# Altium schematic sheet Piezo_Regulator_Head_Power.SchDoc (part 2 of 3)
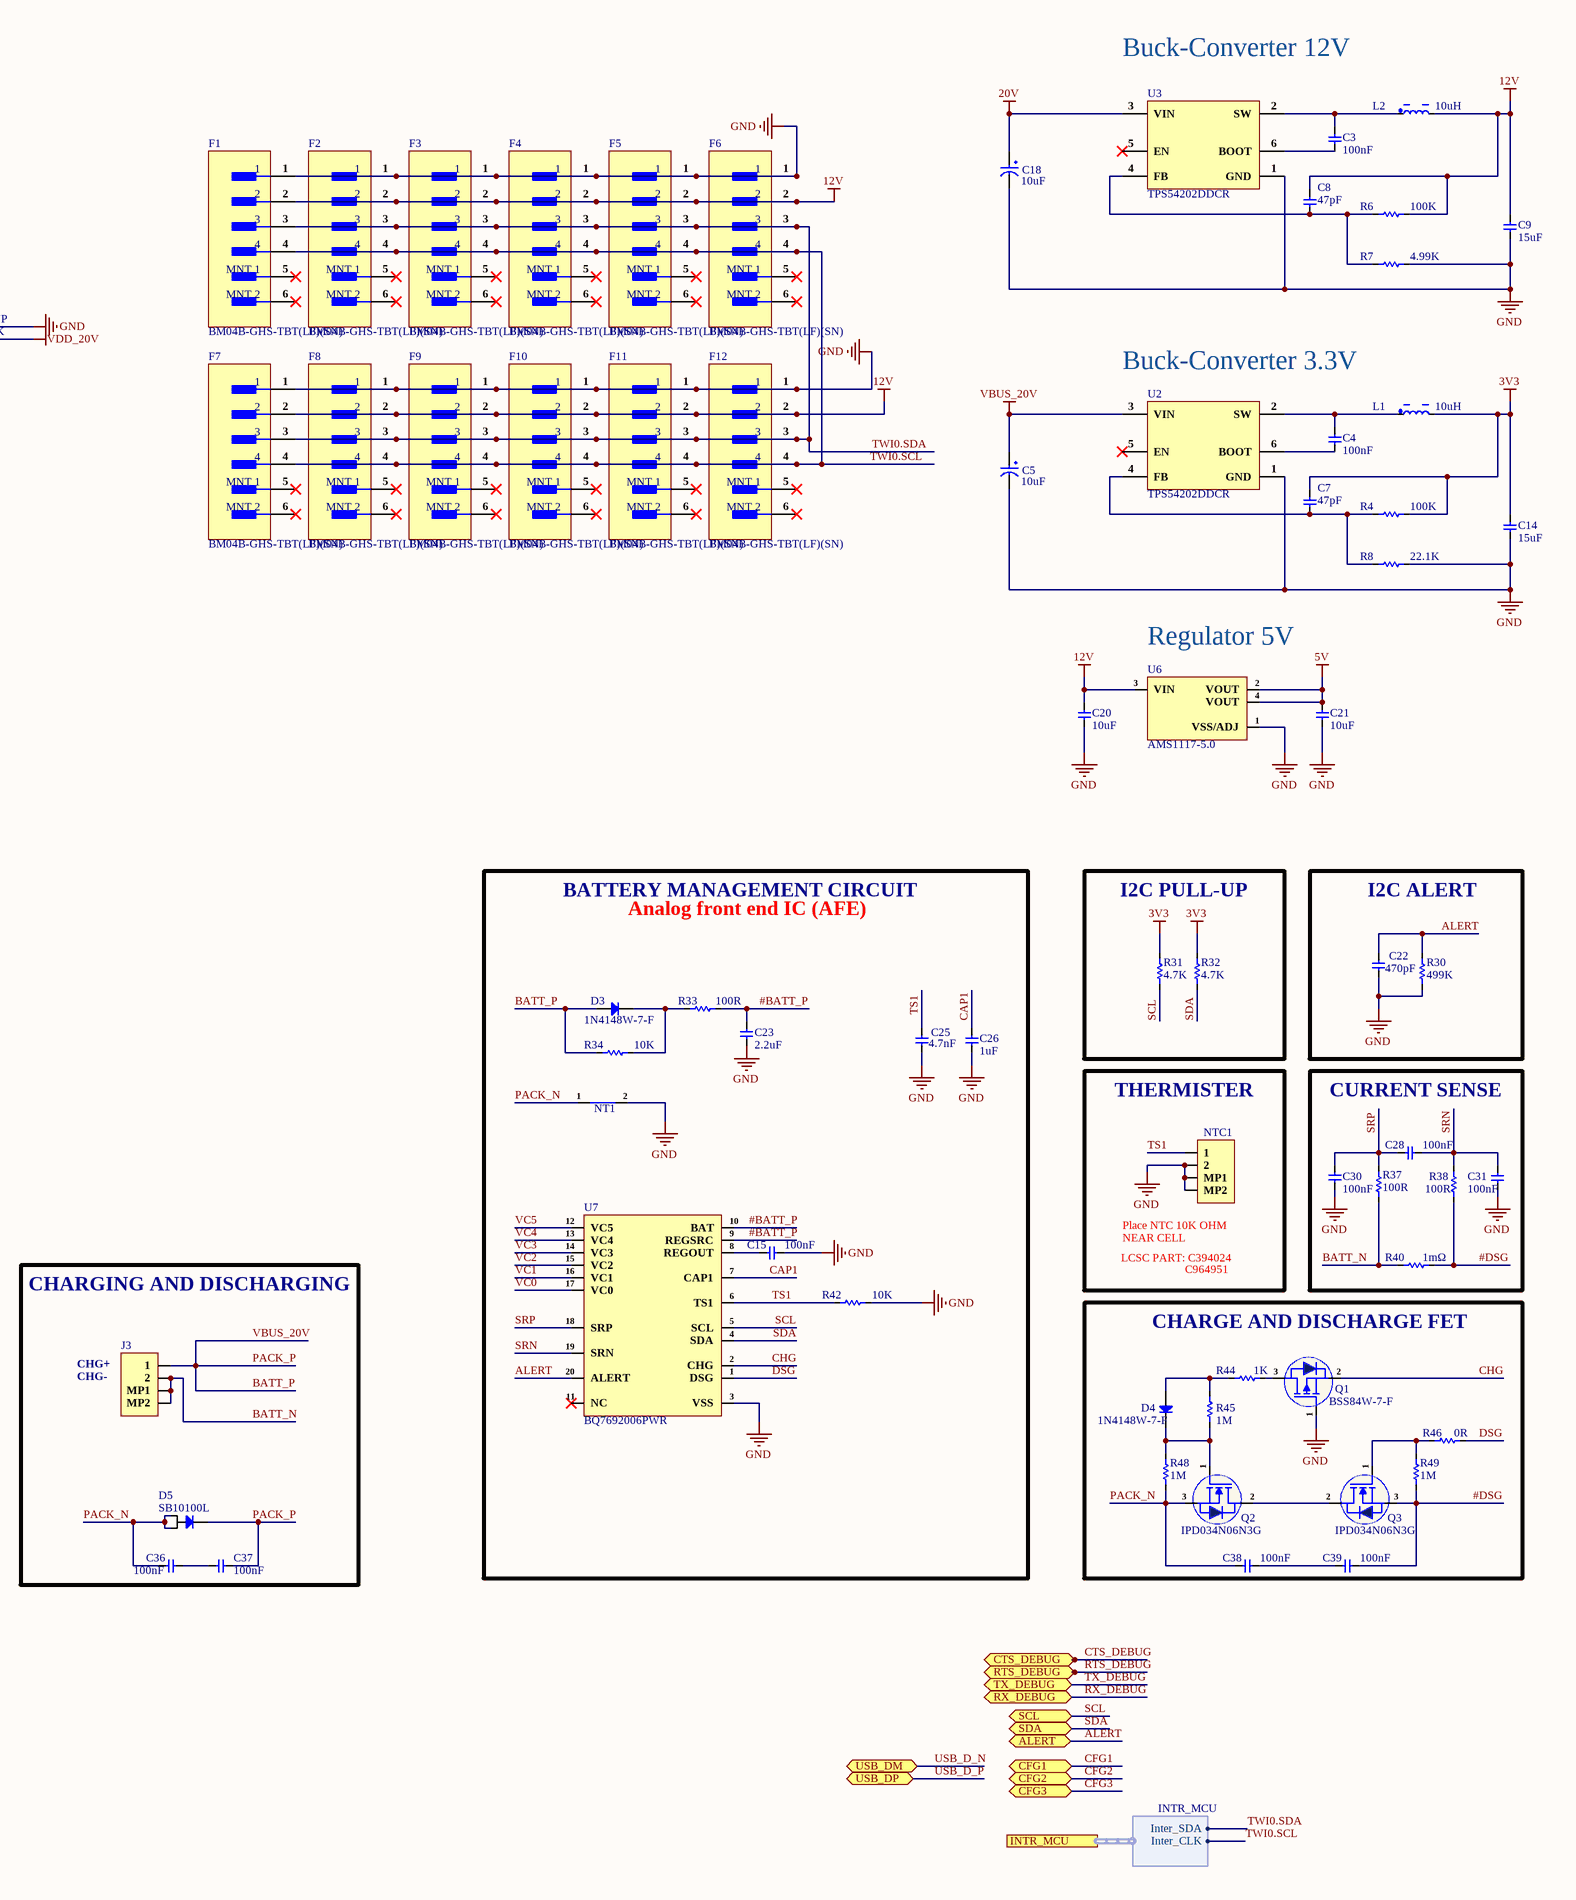
[diagram p2: Piezo_Regulator_Head_Power.SchDoc, right]
## Library data of the parts
C3 C4 C15 C28 C30 C31 C36-C39 = CC0603KRX5R9BB104: CAP CER 0.1UF 50V X5R 0603; Manufacturer: Yageo; Tolerance: 10%; Item Type: Capacitor; Supplier 1: Digi-Key; Manufacturer Part Number: CC0603KRX5R9BB104; RoHS: Yes; Category: Ceramic Capacitors; Stock 1: 152253; Pricing 1: 1=0.10000, 10=0.05200, 50=0.02820, 100=0.02310, 500=0.01648, 1000=0.01294 (USD); Mount: Surface Mount; Case/Package: 0603; Case Code (Imperial): 0603; Case Code (Metric): 1608; Weight: 7.1E-05oz; Min Operating Temperature: -55°C; Max Operating Temperature: 85°C; Capacitance: 100nF; Packaging: Tape and Reel; Voltage Rating: 50V; Dielectric: X5R; Termination: SMD/SMT; Voltage Rating (DC): 50V; Package Quantity: 4000; Length: 0.063inch; Width: 0.031inch; Thickness: 0.035inch; Lead Free: Lead Free; Halogen Free: Halogen Free; ComponentLink1URL: http://www.mouser.com/ds/2/447/Yageo_UPY-GP_NP0_16V-to-50V_9-358835.pdf?src-supplier=Mouser; ComponentLink1Description: http://www.mouser.com/ds/2/447/Yageo_UPY-GP_NP0_16V-to-50V_9-358835.pdf?src-supplier=Mouser; ComponentLink2URL: https://www.yageo.com/upload/media/product/productsearch/datasheet/mlcc/UPY-GPHC_X5R_4V-to-50V_26.pdf?src-supplier=Digi-Key; ComponentLink2Description: https://www.yageo.com/upload/media/product/productsearch/datasheet/mlcc/UPY-GPHC_X5R_4V-to-50V_26.pdf?src-supplier=Digi-Key; ComponentLink3URL: http://www.yageo.com/exep/pages/download/literatures/ProductSelectionGuide%202014_Final_2.pdf?src-supplier=Digi-Key; ComponentLink3Description: http://www.yageo.com/exep/pages/download/literatures/ProductSelectionGuide%202014_Final_2.pdf?src-supplier=Digi-Key; Supplier Part Number 1: 311-4046-1-ND; LCSC Part Number: C110022
C5 C18 = TAJC106K035RNJ: CAP TANT 10UF 10% 35V 2312; Manufacturer: Kyocera AVX; Item Type: Tantalum Capacitors; Dielectric Material: Tantalum; Tolerance: 20%; ESR (Equivalent Series Resistance): 1.6R; Leakage Current: 3.5uA; Polarity: Polar; Voltage: 25V; Dissipation Factor: 6%; Life (Hours): 2000Hour; Ripple Current: 262mA; Supplier: Avnet; Supplier Part Number: TAJC106K035RNJ; Manufacturer Part Number: TAJC106K035RNJ; RoHS: Yes; Stock: 20000; Pricing: 500=0.4611, 1000=0.4505, 2000=0.4399, 3000=0.4293, 4000=0.4187, 5000=0.4081, 50000=0.4028 (USD); Mounting Technology: Surface Mount,PCB; Case/Package: Molded; Pins: 2; Case Code (Imperial): 2312; Case Code (Metric): 6032; Min Operating Temperature: -55°C; Max Operating Temperature: 125°C; Value: 10uF; Voltage Rating (DC): 35V; Voltage Rating: 35V; Features: General Purpose; Series: TAJ; Packaging: Tape and Reel; Package Quantity: 500; Termination: SMD/SMT; Construction: Flat; Length: 6mm; Width: 3.2mm; Height: 2.6mm; Depth: 3.2mm; Radiation Hardening: No; Lead Free: Lead Free; RoHS Compliant: Yes; Reach SVHC Compliant: No; ComponentLink1URL: https://datasheet.ciiva.com/11793/0900766b80ccdc61-11793205.pdf?src-supplier=Rs; ComponentLink1Description: https://datasheet.ciiva.com/11793/0900766b80ccdc61-11793205.pdf?src-supplier=Rs; ComponentLink2URL: https://datasheet.ciiva.com/26341/559442-da-01-en-tacc-c-6-0-mm-x-3-2-mm-x-2-6-mm-10-uf-26341782.pdf?src-supplier=Conrad; ComponentLink2Description: https://datasheet.ciiva.com/26341/559442-da-01-en-tacc-c-6-0-mm-x-3-2-mm-x-2-6-mm-10-uf-26341782.pdf?src-supplier=Conrad; ComponentLink3URL: https://datasheet.ciiva.com/5937/taj-5937099.pdf?src-supplier=Farnell; ComponentLink3Description: https://datasheet.ciiva.com/5937/taj-5937099.pdf?src-supplier=Farnell; ComponentLink4URL: https://datasheet.ciiva.com/7730/taj-7730983.pdf?src-supplier=Element14; ComponentLink4Description: https://datasheet.ciiva.com/7730/taj-7730983.pdf?src-supplier=Element14; ComponentLink5URL: https://datasheet.ciiva.com/7730/1703059-7730751.pdf?src-supplier=Element14; ComponentLink5Description: https://datasheet.ciiva.com/7730/1703059-7730751.pdf?src-supplier=Element14; ComponentLink6URL: https://datasheet.ciiva.com/7730/1703059-7730750.pdf?src-supplier=Element14; ComponentLink6Description: https://datasheet.ciiva.com/7730/1703059-7730750.pdf?src-supplier=Element14; ComponentLink7URL: https://datasheet.ciiva.com/7730/1680476-7730748.pdf?src-supplier=Element14; ComponentLink7Description: https://datasheet.ciiva.com/7730/1680476-7730748.pdf?src-supplier=Element14; ComponentLink8URL: https://datasheet.ciiva.com/7730/13070-7730749.pdf?src-supplier=Element14; ComponentLink8Description: https://datasheet.ciiva.com/7730/13070-7730749.pdf?src-supplier=Element14; ComponentLink9URL: https://datasheet.ciiva.com/264/taj-264350.pdf?src-supplier=Digikey; ComponentLink9Description: https://datasheet.ciiva.com/264/taj-264350.pdf?src-supplier=Digikey; ComponentLink10URL: https://datasheet.ciiva.com/264/taj-264349.pdf?src-supplier=Digikey; ComponentLink10Description: https://datasheet.ciiva.com/264/taj-264349.pdf?src-supplier=Digikey; ComponentLink11URL: https://datasheet.ciiva.com/264/taj-264351.pdf?src-supplier=Digikey; ComponentLink11Description: https://datasheet.ciiva.com/264/taj-264351.pdf?src-supplier=Digikey; ComponentLink12URL: https://datasheet.ciiva.com/12911/taj-27497-12911561.pdf?src-supplier=Mouser; ComponentLink12Description: https://datasheet.ciiva.com/12911/taj-27497-12911561.pdf?src-supplier=Mouser; ComponentLink13URL: https://datasheet.ciiva.com/14590/70001050-14590313.pdf?src-supplier=Allied+Electronics; ComponentLink13Description: https://datasheet.ciiva.com/14590/70001050-14590313.pdf?src-supplier=Allied+Electronics; ComponentLink14URL: https://datasheet.ciiva.com/3004/taj-3004476.pdf?src-supplier=Avnet; ComponentLink14Description: https://datasheet.ciiva.com/3004/taj-3004476.pdf?src-supplier=Avnet; ComponentLink15URL: https://datasheet.ciiva.com/15163/getdatasheetpartid-110753-15163367.pdf?src-supplier=Verical; ComponentLink15Description: https://datasheet.ciiva.com/15163/getdatasheetpartid-110753-15163367.pdf?src-supplier=Verical; ComponentLink16URL: https://datasheet.ciiva.com/3004/taj-3004475.pdf?src-supplier=Avnet; ComponentLink16Description: https://datasheet.ciiva.com/3004/taj-3004475.pdf?src-supplier=Avnet; LCSC Part Number: C7211
C7 C8 = CC0603FRNPO9BN470: CAP CER 47PF 50V NPO 0603; Manufacturer: Yageo; Item Type: Capacitor; Supplier: Digikey; LCSC Part Number: C519486; Manufacturer Part Number: CC0603FRNPO9BN470; RoHS: Yes; Stock: 37282; Pricing: 1=0.19, 10=0.126, 50=0.0756, 100=0.0594, 500=0.0439, 1000=0.03634 (USD); ComponentLink1URL: https://datasheet.ciiva.com/5425/upy-gp-np0-16v-to-50v-8-5425545.pdf?src-supplier=Mouser; ComponentLink1Description: https://datasheet.ciiva.com/5425/upy-gp-np0-16v-to-50v-8-5425545.pdf?src-supplier=Mouser; ComponentLink2URL: https://datasheet.ciiva.com/11586/upy-gp-np0-16v-to-50v-8-11586472.pdf?src-supplier=Avnet; ComponentLink2Description: https://datasheet.ciiva.com/11586/upy-gp-np0-16v-to-50v-8-11586472.pdf?src-supplier=Avnet
C9 C14 = C3216X5R1V156M160AC: CAP CER 15UF 35V X5R 1206; Manufacturer: TDK; Manufacturer Lifecycle Status: PRODUCTION; Item Type: Capacitors; Value: 15µF; Dielectric Material: Ceramic; Tolerance: 20%; Supplier: Avnet; Supplier Part Number: 71AH3361; Manufacturer Part Number: C3216X5R1V156M160AC; RoHS: Compliant; Stock: 2242; Pricing: 1=0.987, 10=0.517, 25=0.485, 50=0.453, 100=0.421 (USD); Case/Package: 1206; Case Code (Imperial): 1206; Case Code (Metric): 3216; China RoHS: Compliant; Composition: Ceramic; Dielectric: X5R; Height: 1.6mm; Lead Free: Lead Free; Length: 3.2mm; Lifecycle Status: Production; Material: Ceramic; Max Length: 3.4mm; Max Operating Temperature: 85°C; Max Width: 1.8mm; Min Length: 3mm; Min Operating Temperature: -55°C; Min Width: 1.4mm; Mounting Technology: Surface Mount; Number of Terminals: 2; Packaging: Digi-Reel®; REACH SVHC: Yes; Schedule B: 8532240020, 8532240020|8532240020|8532240020|8532240020|8532240020; Termination: SMD/SMT; Voltage Rating: 35V; Voltage Rating (DC): 35V; Width: 1.6mm; ComponentLink1URL: https://datasheet.octopart.com:443/C3216X5R1V156M160AC-TDK-datasheet-175423548.pdf?src-supplier=TME; ComponentLink1Description: https://datasheet.octopart.com:443/C3216X5R1V156M160AC-TDK-datasheet-175423548.pdf?src-supplier=TME; ComponentLink2URL: https://datasheet.octopart.com:443/C3216X5R1V156M160AC-TDK-datasheet-151546523.pdf?src-supplier=TDK; ComponentLink2Description: https://datasheet.octopart.com:443/C3216X5R1V156M160AC-TDK-datasheet-151546523.pdf?src-supplier=TDK; ComponentLink3URL: https://datasheet.octopart.com/C3216X5R1V156M160AC-TDK-datasheet-41194876.pdf; ComponentLink3Description: https://datasheet.octopart.com/C3216X5R1V156M160AC-TDK-datasheet-41194876.pdf
C19 = 08055C105KAT2A: CAP CER 1UF 50V X7R 0805; Manufacturer: Kyocera AVX; Item Type: Capacitors; Material: Ceramic; Tolerance: 10%; Supplier: Rs; LCSC Part Number: C2167382; Manufacturer Part Number: 08055C105KAT2A; RoHS: Yes; Stock: 6530; Pricing: 10=1.518, 50=1.406, 100=1.309, 250=1.137, 500=0.98 (DKK); Mounting Technology: Surface Mount; Case/Package: 0805; Case Code (Metric): 2012; Case Code (Imperial): 0805; Min Operating Temperature: -55°C; Max Operating Temperature: 125°C; Value: 1uF; Dielectric: X7R; Termination: SMD/SMT; Voltage: 50V; Packaging: Tape and Reel; Voltage Rating: 50V; Package Quantity: 1; Series: -; Length: 2.01mm; Width: 0.049inch; Depth: 1.25mm; Thickness: 0.037inch; Reach SVHC Compliant: No; Lead Free: Lead Free; RoHS Compliant: Yes; ComponentLink1URL: https://datasheet.ciiva.com/25613/0900766b810a29b7-25613127.pdf?src-supplier=Rs; ComponentLink1Description: https://datasheet.ciiva.com/25613/0900766b810a29b7-25613127.pdf?src-supplier=Rs; ComponentLink2URL: https://datasheet.ciiva.com/6268/cx7r-6268826.pdf?src-supplier=Digikey; ComponentLink2Description: https://datasheet.ciiva.com/6268/cx7r-6268826.pdf?src-supplier=Digikey; ComponentLink3URL: https://datasheet.ciiva.com/7812/cx7r-7812085.pdf?src-supplier=Element14; ComponentLink3Description: https://datasheet.ciiva.com/7812/cx7r-7812085.pdf?src-supplier=Element14; ComponentLink4URL: https://datasheet.ciiva.com/22706/1679506-22706999.pdf?src-supplier=Element14; ComponentLink4Description: https://datasheet.ciiva.com/22706/1679506-22706999.pdf?src-supplier=Element14; ComponentLink5URL: https://datasheet.ciiva.com/46385/1818074-46385893.pdf?src-supplier=Element14; ComponentLink5Description: https://datasheet.ciiva.com/46385/1818074-46385893.pdf?src-supplier=Element14; ComponentLink6URL: https://datasheet.ciiva.com/14887/cx7r-14887080.pdf?src-supplier=Digikey; ComponentLink6Description: https://datasheet.ciiva.com/14887/cx7r-14887080.pdf?src-supplier=Digikey; ComponentLink7URL: https://datasheet.ciiva.com/14887/cx7r-14887081.pdf?src-supplier=Digikey; ComponentLink7Description: https://datasheet.ciiva.com/14887/cx7r-14887081.pdf?src-supplier=Digikey
C20 C21 = C1608X5R1E106M080AC: CAP CER 10UF 25V X5R 0603; Manufacturer: TDK; Dielectric Material: Ceramic; Tolerance: 20%; Item Type: Capacitor; Supplier 1: Digi-Key; Manufacturer Part Number: C1608X5R1E106M080AC; Stock 1: 61681; Pricing 1: 1=0.96, 10=0.704, 100=0.483, 500=0.38238, 1000=0.322 (USD); Mount: Surface Mount; Case/Package: 0603; Weight: 7.1E-05oz; Case Code (Imperial): 0603; Case Code (Metric): 1608; Min Operating Temperature: -55°C; Max Operating Temperature: 85°C; Capacitance: 10uF; Packaging: Tape and Reel; Voltage Rating: 25V; Voltage Rating (DC): 25V; Termination: SMD/SMT; Package Quantity: 1; Dielectric: X5R; Composition: Ceramic; Length: 1.6mm; Height: 0.8mm; Width: 0.8mm; Thickness: 0.039inch; Depth: 0.8mm; Lead Free: Lead Free; REACH SVHC: No SVHC; Supplier Part Number 1: 445-9015-1-ND; LCSC Part Number: C2168289
C22 = 0603B471K500CT: CAP CER 470PF 50V X7R 0603; Manufacturer: Walsin Technologies; Tolerance: 10%; Item Type: Capacitor; Supplier 1: Arrow Electronics; Manufacturer Part Number: 0603B471K500CT; RoHS: Yes; Category: Ceramic Capacitors; Stock 1: 136000; Pricing 1: 4000=0.00550, 8000=0.00460, 12000=0.00440, 40000=0.00430 (USD); Case/Package: Ceramic; Case Code (Metric): 1608; Case Code (Imperial): 0603; Min Operating Temperature: -55°C; Max Operating Temperature: 125°C; Capacitance: 470pF; Packaging: Tape and Reel; Dielectric: X7R; Voltage Rating: 50V; Voltage Rating (DC): 50V; Length: 1.6mm; Depth: 0.8mm; Radiation Hardening: No; RoHS Compliant: Yes; REACH SVHC: Unknown; Lead Free: Lead Free; ComponentLink1URL: https://www.verical.com/server-webapp/html/getDatasheet?partID=467798&src-supplier=Verical; ComponentLink1Description: https://www.verical.com/server-webapp/html/getDatasheet?partID=467798&src-supplier=Verical; ComponentLink2URL: http://www.farnell.com/datasheets/2340522.pdf?src-supplier=Farnell; ComponentLink2Description: http://www.farnell.com/datasheets/2340522.pdf?src-supplier=Farnell; ComponentLink3URL: http://www.passivecomponent.com/indexsea/0603B471K500CT-IS.pdf?src-supplier=Digi-Key; ComponentLink3Description: http://www.passivecomponent.com/indexsea/0603B471K500CT-IS.pdf?src-supplier=Digi-Key; ComponentLink4URL: http://www.passivecomponent.com/wp-content/uploads/2018/10/MLCC.pdf?src-supplier=Digi-Key; ComponentLink4Description: http://www.passivecomponent.com/wp-content/uploads/2018/10/MLCC.pdf?src-supplier=Digi-Key; ComponentLink5URL: http://www.farnell.com/datasheets/1958513.pdf?src-supplier=Element14; ComponentLink5Description: http://www.farnell.com/datasheets/1958513.pdf?src-supplier=Element14; ComponentLink6URL: http://www.farnell.com/datasheets/2340522.pdf?src-supplier=Newark; ComponentLink6Description: http://www.farnell.com/datasheets/2340522.pdf?src-supplier=Newark; Supplier Part Number 1: 0603B471K500CT; LCSC Part Number: C93192
C23 = CC0805KKX5R9BB225: CAP CER 2.2UF 50V X5R 0805; Manufacturer: Yageo; Tolerance: 10%; Item Type: Capacitor; Supplier 1: Mouser; Manufacturer Part Number: CC0805KKX5R9BB225; RoHS: Yes; Category: Ceramic Capacitors; Stock 1: 3880; Pricing 1: 1=0.26000, 10=0.12100, 50=0.12100, 100=0.08700, 1000=0.06700, 10000=0.05000 (USD); Mounting Technology: Surface Mount; Case/Package: 0805; Case Code (Metric): 2012; Case Code (Imperial): 0805; Weight: 0.000194oz; Min Operating Temperature: -55°C; Max Operating Temperature: 85°C; Packaging: Tape and Reel; Value: 2.2uF; Voltage Rating: 50V; Dielectric: X5R; Termination: SMD/SMT; Resistor Type: Ceramic; Voltage Rating (DC): 50V; Package Quantity: 3000; Length: 0.079inch; Width: 1.25mm; Thickness: 0.057inch; Lead Free: Lead Free; Halogen Free: Halogen Free; RoHS Compliant: Yes; ComponentLink1URL: http://www.mouser.com/ds/2/447/Yageo_UPY-GP_NP0_16V-to-50V_9-358835.pdf?src-supplier=Mouser; ComponentLink1Description: http://www.mouser.com/ds/2/447/Yageo_UPY-GP_NP0_16V-to-50V_9-358835.pdf?src-supplier=Mouser; ComponentLink2URL: http://www.yageo.com/documents/recent/UPY-GPHC_X5R_4V-to-50V_25.pdf?src-supplier=Digi-Key; ComponentLink2Description: http://www.yageo.com/documents/recent/UPY-GPHC_X5R_4V-to-50V_25.pdf?src-supplier=Digi-Key; Supplier Part Number 1: 603-CC805KKX5R9BB225; LCSC Part Number: C326581
C25 = CC0603JRNPO9BN472: CAP CER 4700PF 50V C0G/NPO 0603; Manufacturer: Yageo; Item Type: Capacitor; Supplier 1: Digi-Key; Manufacturer Part Number: CC0603JRNPO9BN472; RoHS: Yes; Category: Ceramic Capacitors; Stock 1: 31779; Pricing 1: 1=0.48000, 10=0.33000, 50=0.23100, 100=0.19800, 500=0.14854, 1000=0.12543 (USD); RoHS Compliant: Yes; Supplier Part Number 1: 13-CC0603JRNPO9BN472CT-ND; LCSC Part Number: C576818; ComponentLink1Description: LCSC; ComponentLink1URL: https://www.lcsc.com/product-detail/Multilayer-Ceramic-Capacitors-MLCC-SMD-SMT_YAGEO-CC0603JRNPO9BN472_C576818.html
C26 C27 C32-C35 = C1608X7R1E105K080AB: CAP CER 1UF 25V X7R 0603; Manufacturer: TDK; Item Type: Capacitors; Material: 4241ConductorMaterial; Tolerance: 10%; Supplier: Digikey; Manufacturer Part Number: C1608X7R1E105K080AB; RoHS: Yes; Stock: 239206; Pricing: 1=0.18, 10=0.103, 50=0.0722, 100=0.0627, 500=0.04664, 1000=0.04163 (USD); Mounting Technology: Surface Mount; Case/Package: 0603; Case Code (Metric): 1608; Case Code (Imperial): 0603; Dielectric Material: 4241ConductorMaterial; Min Operating Temperature: -55°C; Max Operating Temperature: 125°C; Value: 1uF; Package Quantity: 1; Voltage Rating: 25V; Packaging: Tape and Reel; Dielectric: X7R; Voltage: 25V; Series: C; Construction: Flat; Length: 1.6mm; Width: 0.031inch; Height: 0.8mm; Thickness: 0.037inch; Depth: 0.8mm; Radiation Hardening: No; Reach SVHC Compliant: No; Lead Free: Lead Free; RoHS Compliant: Yes; ComponentLink1URL: https://datasheet.ciiva.com/23802/1796654-23802776.pdf?src-supplier=Newark; ComponentLink1Description: https://datasheet.ciiva.com/23802/1796654-23802776.pdf?src-supplier=Newark; ComponentLink2URL: https://datasheet.ciiva.com/22725/1913358-22725530.pdf?src-supplier=Element14; ComponentLink2Description: https://datasheet.ciiva.com/22725/1913358-22725530.pdf?src-supplier=Element14; ComponentLink3URL: https://datasheet.ciiva.com/28693/mlcc-commercial-general-en-28693447.pdf?src-supplier=Element14; ComponentLink3Description: https://datasheet.ciiva.com/28693/mlcc-commercial-general-en-28693447.pdf?src-supplier=Element14; ComponentLink4URL: https://datasheet.ciiva.com/6290/tdkmlcccaprange-6290854.pdf?src-supplier=Digikey; ComponentLink4Description: https://datasheet.ciiva.com/6290/tdkmlcccaprange-6290854.pdf?src-supplier=Digikey; ComponentLink5URL: https://datasheet.ciiva.com/26834/getdatasheetpartid-727834-26834380.pdf?src-supplier=Verical; ComponentLink5Description: https://datasheet.ciiva.com/26834/getdatasheetpartid-727834-26834380.pdf?src-supplier=Verical
D1 = SMBJ24A: SMB(DO-214AA); Manufacturer: SMC; Item Type: TVS Diode; Manufacturer Part Number: SMBJ24A; Package: SMB(DO-214AA); LCSC Part Number: C493201
D2 = QBLP617-IB: LED BLUE CLEAR 0602 SMD R/A; Manufacturer: QT Brightek; Item Type: LEDs; Forward Current: 20mA; Forward Voltage: 3.1V; Luminous Intensity: 63mcd; Number of Circuits: 1; Power Dissipation: 111mW; Reverse Voltage: 5V; Shape: Rectangular; Viewing Angle: 140°; Wavelength: 470nm; Supplier: Arrow Electronics; Supplier Part Number: QBLP617-IB; Manufacturer Part Number: QBLP617-IB; RoHS: Compliant; Stock: 1867; Pricing: 1=0.0007 (USD); Case/Package: 0602; Color: Blue; Height: 600µm; Max Operating Temperature: 80°C; Min Operating Temperature: -40°C; Mounting Technology: Surface Mount; Number of Terminals: 2; REACH SVHC: Yes; Schedule B: 8541402000, 8541402000|8541402000|8541402000|8541402000|8541402000, 8541410000; Terminal Pitch: 2.1mm; ComponentLink1URL: https://datasheet.octopart.com:443/QBLP617-IB-QT-Brightek-datasheet-140961254.pdf?src-supplier=IHS; ComponentLink1Description: https://datasheet.octopart.com:443/QBLP617-IB-QT-Brightek-datasheet-140961254.pdf?src-supplier=IHS
D3 D4 = 1N4148W-7-F: DIODE GEN PURP 100V 300MA SOD123; Manufacturer: Diodes; Forward Current: 150mA; Reverse Recovery Time: 4ns; Max Forward Surge Current (Ifsm): 2A; Element Configuration: Single; Max Reverse Current: 1uA; Forward Voltage: 1.25V; Power Dissipation: 400mW; Polarity: Standard; Voltage Rating (DC): 75V; Value: 2pF; Supplier 1: Future Electronics; Manufacturer Part Number: 1N4148W-7-F; RoHS: Yes; Category: Rectifier Diodes; Stock 1: 32931000; Pricing 1: 3000=0.01840, 12000=0.01760, 45000=0.01690, 120000=0.01640, 300000=0.01560 (USD); Mounting Technology: Surface Mount; Pins: 2; Weight: 0.000353oz; Contact Plating: Tin,Matte; Min Operating Temperature: -65°C; Max Operating Temperature: 150°C; Packaging: Tape and Reel; Max Repetitive Reverse Voltage (Vrrm): 100V; Peak Non-Repetitive Surge Current: 2A; Voltage: 100V; Max Surge Current: 2A; Package Quantity: 3000; Recovery Time: 4ns; Average Rectified Current: 300mA; Power Rating: 400mW; Current Rating: 150mA; Output Current: 150mA; Max Reverse Voltage (DC): 100V; Series: -; Reverse Recovery Time-Max: 4ns; Length: 2.85mm; Width: 1.7mm; Height: 1.25mm; Radiation Hardening: No; RoHS Compliant: Yes; Reach SVHC Compliant: Yes; Lead Free: Lead Free; ComponentLink1URL: https://datasheet.ciiva.com/1179/1915529-1179304.pdf?src-supplier=Element14; ComponentLink1Description: https://datasheet.ciiva.com/1179/1915529-1179304.pdf?src-supplier=Element14; ComponentLink2URL: https://datasheet.ciiva.com/22695/1915529-22695239.pdf?src-supplier=Element14; ComponentLink2Description: https://datasheet.ciiva.com/22695/1915529-22695239.pdf?src-supplier=Element14; ComponentLink3URL: https://datasheet.ciiva.com/8300/ds30086-8300392.pdf?src-supplier=Avnet; ComponentLink3Description: https://datasheet.ciiva.com/8300/ds30086-8300392.pdf?src-supplier=Avnet; ComponentLink4URL: https://datasheet.ciiva.com/15219/getdatasheetpartid-110030-15219548.pdf?src-supplier=Verical; ComponentLink4Description: https://datasheet.ciiva.com/15219/getdatasheetpartid-110030-15219548.pdf?src-supplier=Verical; ComponentLink5URL: https://datasheet.ciiva.com/8303/ds30086-8303197.pdf?src-supplier=Avnet; ComponentLink5Description: https://datasheet.ciiva.com/8303/ds30086-8303197.pdf?src-supplier=Avnet; ComponentLink6URL: https://datasheet.ciiva.com/911/ds30086-911735.pdf?src-supplier=Digi-Key; ComponentLink6Description: https://datasheet.ciiva.com/911/ds30086-911735.pdf?src-supplier=Digi-Key; ComponentLink7URL: https://datasheet.ciiva.com/911/ds30086-911736.pdf?src-supplier=Digi-Key; ComponentLink7Description: https://datasheet.ciiva.com/911/ds30086-911736.pdf?src-supplier=Digi-Key; ComponentLink8URL: https://datasheet.ciiva.com/911/ds30086-911734.pdf?src-supplier=Digi-Key; ComponentLink8Description: https://datasheet.ciiva.com/911/ds30086-911734.pdf?src-supplier=Digi-Key; ComponentLink9URL: https://datasheet.ciiva.com/4435/ds30086-4435128.pdf?src-supplier=Mouser; ComponentLink9Description: https://datasheet.ciiva.com/4435/ds30086-4435128.pdf?src-supplier=Mouser; Supplier Part Number 1: 7634694; LCSC Part Number: C83528; Item Type: Diode
D5 = SB10100L: TO-277 Schottky Barrier Diodes (SBD) ROHS; Manufacturer: TWGMC; Item type: Diode; Manufacturer Part Number: SB10100L; Package: TO-277; ComponentLink1Description: LCSC; ComponentLink1URL: https://www.lcsc.com/product-detail/Schottky-Barrier-Diodes-SBD_TWGMC-SB10100L_C5240369.html; LCSC Part Number: C5240369
D6 = PDS760-13: DIODE SCHOTTKY 60V 7A POWERDI5; Manufacturer: Diodes; Supplier: Future Electronics; Supplier Part Number: 7738990; Manufacturer Part Number: PDS760-13; RoHS: No; Category: Rectifier Diodes; Stock: 295000; Pricing: 5000=0.31, 10000=0.305, 15000=0.3, 20000=0.3 (USD); Reverse Voltage: 60V; ComponentLink1URL: https://datasheet.ciiva.com/4715/ds30477-62081-4715698.pdf?src-supplier=Mouser; ComponentLink1Description: https://datasheet.ciiva.com/4715/ds30477-62081-4715698.pdf?src-supplier=Mouser; ComponentLink2URL: https://datasheet.ciiva.com/915/ds30477-915170.pdf?src-supplier=Digikey; ComponentLink2Description: https://datasheet.ciiva.com/915/ds30477-915170.pdf?src-supplier=Digikey; ComponentLink3URL: https://datasheet.ciiva.com/16475/ds30477-16475660.pdf?src-supplier=Future+Electronics; ComponentLink3Description: https://datasheet.ciiva.com/16475/ds30477-16475660.pdf?src-supplier=Future+Electronics; ComponentLink4URL: https://datasheet.ciiva.com/7964/ds30477-7964294.pdf?src-supplier=Element14; ComponentLink4Description: https://datasheet.ciiva.com/7964/ds30477-7964294.pdf?src-supplier=Element14; ComponentLink5URL: https://datasheet.ciiva.com/8301/ds30477-8301047.pdf?src-supplier=Avnet; ComponentLink5Description: https://datasheet.ciiva.com/8301/ds30477-8301047.pdf?src-supplier=Avnet; ComponentLink6URL: https://datasheet.ciiva.com/8301/ds30477-8301849.pdf?src-supplier=Avnet; ComponentLink6Description: https://datasheet.ciiva.com/8301/ds30477-8301849.pdf?src-supplier=Avnet; ComponentLink7URL: https://datasheet.ciiva.com/915/ds30477-915171.pdf?src-supplier=Digikey; ComponentLink7Description: https://datasheet.ciiva.com/915/ds30477-915171.pdf?src-supplier=Digikey; ComponentLink8URL: https://datasheet.ciiva.com/915/ds30477-915172.pdf?src-supplier=Digikey; ComponentLink8Description: https://datasheet.ciiva.com/915/ds30477-915172.pdf?src-supplier=Digikey; LCSC Part Number: C96113; Item Type: Diode
D7 D8 = ESD5B5.0ST1G: TVS DIODE 5VWM SOD523; Manufacturer: ON Semiconductor; Item Type: ESD Protection Device; Supplier: Future Electronics; Supplier Part Number: 1159725; Manufacturer Part Number: ESD5B5.0ST1G; RoHS: Yes; Category: ESD and Circuit Protection ICs; Stock: 486000; Pricing: 3000=0.0396, 9000=0.0381, 15000=0.0375, 60000=0.0357, 90000=0.0346 (USD); ComponentLink1URL: https://datasheet.ciiva.com/339/esd5b5-0st1g-339772.pdf?src-supplier=Avnet; ComponentLink1Description: https://datasheet.ciiva.com/339/esd5b5-0st1g-339772.pdf?src-supplier=Avnet; ComponentLink2URL: https://datasheet.ciiva.com/339/esd5b5-0st1g-339772.pdf?src-supplier=Digi-Key; ComponentLink2Description: https://datasheet.ciiva.com/339/esd5b5-0st1g-339772.pdf?src-supplier=Digi-Key; ComponentLink3URL: https://datasheet.ciiva.com/22637/716649-22637178.pdf?src-supplier=Element14; ComponentLink3Description: https://datasheet.ciiva.com/22637/716649-22637178.pdf?src-supplier=Element14; ComponentLink4URL: https://datasheet.ciiva.com/4510/esd5b5-0st1g-241623-4510548.pdf?src-supplier=Mouser; ComponentLink4Description: https://datasheet.ciiva.com/4510/esd5b5-0st1g-241623-4510548.pdf?src-supplier=Mouser; ComponentLink5URL: https://datasheet.ciiva.com/339/esd5b5-0st1-d-339773.pdf?src-supplier=Digi-Key; ComponentLink5Description: https://datasheet.ciiva.com/339/esd5b5-0st1-d-339773.pdf?src-supplier=Digi-Key; ComponentLink6URL: https://datasheet.ciiva.com/339/esd5b5-0st1-d-339774.pdf?src-supplier=Digi-Key; ComponentLink6Description: https://datasheet.ciiva.com/339/esd5b5-0st1-d-339774.pdf?src-supplier=Digi-Key; LCSC Part Number: C93623
F1-F12 = BM04B-GHS-TBT(LF)(SN): CONN HEADER SMD 4POS 1.25MM; Manufacturer: JST; Item Type: Card Edge Connectors; Contact Resistance: 50mΩ; Current Rating: 1A; Gender: Male; Insulation Resistance: 100MΩ; Number of Contacts: 4; Voltage Rating: 50V; Wire/Cable Gauge: 26AWG; Supplier: Future Electronics; Supplier Part Number: 7604226; Manufacturer Part Number: BM04B-GHS-TBT(LF)(SN); RoHS: Compliant; Pricing: 2500=0.205, 5000=0.2, 7500=0.199, 10000=0.197 (USD); Case/Package: SMD/SMT; China RoHS: Compliant; Contact Gender: Male; Contact Material: Tin; Contact Plating: Tin; Height: 4.05mm; Housing Color: Natural; Housing Material: Nylon; Lead Free: Lead Free; Lifecycle Status: Production; Max Operating Temperature: 85°C; Min Operating Temperature: -25°C; Pins: 4; Number of Positions: 4; Number of Rows: 1; Orientation: Straight; Packaging: Cut Tape; Pitch: 1.25mm; REACH SVHC: No; Schedule B: 8536694040; Terminal Pitch: 1.25mm; Termination: Crimp; Voltage Rating (AC): 50V; ComponentLink1URL: https://datasheet.octopart.com:443/BM04B-GHS-TBT%28LF%29%28SN%29-JST-datasheet-151632282.pdf?src-supplier=IHS; ComponentLink1Description: https://datasheet.octopart.com:443/BM04B-GHS-TBT%28LF%29%28SN%29-JST-datasheet-151632282.pdf?src-supplier=IHS; ComponentLink2URL: https://datasheet.octopart.com:443/BM04B-GHS-TBT%28LF%29%28SN%29-JST-datasheet-13551083.pdf?src-supplier=Future+Electronics; ComponentLink2Description: https://datasheet.octopart.com:443/BM04B-GHS-TBT%28LF%29%28SN%29-JST-datasheet-13551083.pdf?src-supplier=Future+Electronics; ComponentLink3URL: https://datasheet.octopart.com:443/BM04B-GHS-TBT%28LF%29%28SN%29-JST-datasheet-12527556.pdf?src-supplier=Future+Electronics; ComponentLink3Description: https://datasheet.octopart.com:443/BM04B-GHS-TBT%28LF%29%28SN%29-JST-datasheet-12527556.pdf?src-supplier=Future+Electronics; ComponentLink4URL: https://datasheet.octopart.com:443/BM04B-GHS-TBT%28LF%29%28SN%29-JST-datasheet-10511.pdf?src-supplier=DigiKey; ComponentLink4Description: https://datasheet.octopart.com:443/BM04B-GHS-TBT%28LF%29%28SN%29-JST-datasheet-10511.pdf?src-supplier=DigiKey
F13 = 0458005.DR: FUSE BRD MNT 5A 32VAC 75VDC 1206; Manufacturer: Littelfuse; Supplier: Rs; Supplier Part Number: 1740294; Manufacturer Part Number: 0458005.DR; RoHS: Yes; Category: Fuses; Stock: 1005; Pricing: 1=0.6241, 10=0.73892, 25=0.71895, 50=0.70003 (GBP); ComponentLink1URL: https://datasheet.ciiva.com/1730/337915-1730547.pdf?src-supplier=Newark; ComponentLink1Description: https://datasheet.ciiva.com/1730/337915-1730547.pdf?src-supplier=Newark; ComponentLink2URL: https://datasheet.ciiva.com/7991/337915-7991910.pdf?src-supplier=Element14; ComponentLink2Description: https://datasheet.ciiva.com/7991/337915-7991910.pdf?src-supplier=Element14; ComponentLink3URL: https://datasheet.ciiva.com/299/littelfuse-fuse-458-series-299786.pdf?src-supplier=Digikey; ComponentLink3Description: https://datasheet.ciiva.com/299/littelfuse-fuse-458-series-299786.pdf?src-supplier=Digikey; ComponentLink4URL: https://datasheet.ciiva.com/299/littelfuse-fuse-458-series-299787.pdf?src-supplier=Digikey; ComponentLink4Description: https://datasheet.ciiva.com/299/littelfuse-fuse-458-series-299787.pdf?src-supplier=Digikey; ComponentLink5URL: https://datasheet.ciiva.com/299/littelfuse-fuse-458-series-299788.pdf?src-supplier=Digikey; ComponentLink5Description: https://datasheet.ciiva.com/299/littelfuse-fuse-458-series-299788.pdf?src-supplier=Digikey; LCSC Part Number: C187561; Item Type: Fuse
J2 = TYPE-C-31-M-12: 5A 1 16P Female Type-C SMD USB Connectors ROHS; Manufacturer: Korean Hroparts Elec; ComponentLink1Description: LCSC; ComponentLink1URL: https://www.lcsc.com/product-detail/USB-Connectors_Korean-Hroparts-Elec-TYPE-C-31-M-12_C165948.html; Manufacturer Part Number: TYPE-C-31-M-12; Footprint: Custom; LCSC Part Number: C165948; Item Type: USB Connector
J3 NTC1 = WAFER-PH2.0-2PWB: 1x2P 1 2mm Male pin 2 -25℃~+85℃ 2A Surface Mount SMD,P=2mm Wire To Board / Wire To Wire Connector ROHS; Manufacturer: XUNPU; Item Type: Right Angle JST; Manufacturer Part Number: WAFER-PH2.0-2PWB; Package: SMD,P=2mm; LCSC Part Number: C3029440; ComponentLink1Description: LCSC; ComponentLink1URL: https://www.lcsc.com/product-detail/Wire-To-Board-Wire-To-Wire-Connector_XUNPU-WAFER-PH2-0-2PWB_C3029440.html
J4 = S6B-PH-SM4-TB(LF)(SN): CONN HEADER SMD R/A 6POS 2MM; Manufacturer: JST; Contact Resistance: 20mR; Max Current Rating: 2A; Number of Poles: 6; Voltage Rating (AC): 100V; Insulation Resistance: 1GR; Gender: Male; Item Type: JST Connector; Supplier 1: Rs; Manufacturer Part Number: S6B-PH-SM4-TB(LF)(SN); RoHS: Yes; Category: Connectors; Stock 1: 8280; Pricing 1: 125=0.16040, 500=0.65000, 2500=0.61200, 5000=0.58600 (GBP); Mounting Technology: Surface Mount; Contact Material: Copper Alloy,Tin,Bronze,Brass; Contact Plating: Tin,Copper; Color: White; Housing Color: Beige; Housing Material: Polyamide; Contact Shape: Square; Insulation Material: Nylon; Insulation Color: Natural; Contact Finish - Mating: TIN; Min Operating Temperature: -25°C; Max Operating Temperature: 85°C; Number of Rows: 1; Packaging: Tape and Reel; Current Rating: 2A; Voltage Rating: 100V; Number of Positions: 6; Termination: Solder; Fastening Type: Detent; Max Voltage Rating (AC): 100V; Number of Contacts: 6; Working Voltage: 100V; Max Voltage Rating (DC): 100V; Orientation: Right Angle; Connector Type: Header; Series: PH; Contact Type: Male Pin; Length: 15.9mm; Width: 5mm; Height: 9.4mm; Lead Pitch: 2mm; Pitch: 2mm; Contact Mating Length: 0.13inch; Depth: 7.6mm; Reach SVHC Compliant: Yes; Lead Free: Lead Free; Flammability Rating: UL94 V-0; ComponentLink1URL: https://datasheet.ciiva.com/11747/0900766b80df0d9d-11747278.pdf?src-supplier=Rs; ComponentLink1Description: https://datasheet.ciiva.com/11747/0900766b80df0d9d-11747278.pdf?src-supplier=Rs; ComponentLink2URL: https://datasheet.ciiva.com/8052/1699381-8052221.pdf?src-supplier=Element14; ComponentLink2Description: https://datasheet.ciiva.com/8052/1699381-8052221.pdf?src-supplier=Element14; ComponentLink3URL: https://datasheet.ciiva.com/712/eph-712622.pdf?src-supplier=Digi-Key; ComponentLink3Description: https://datasheet.ciiva.com/712/eph-712622.pdf?src-supplier=Digi-Key; ComponentLink4URL: https://datasheet.ciiva.com/712/eph-712623.pdf?src-supplier=Digi-Key; ComponentLink4Description: https://datasheet.ciiva.com/712/eph-712623.pdf?src-supplier=Digi-Key; ComponentLink5URL: https://datasheet.ciiva.com/730/eph-730589.pdf?src-supplier=Digi-Key; ComponentLink5Description: https://datasheet.ciiva.com/730/eph-730589.pdf?src-supplier=Digi-Key; ComponentLink6URL: https://datasheet.ciiva.com/16340/jsts6b-ph-sm4-tb-lf-sn-16340154.pdf?src-supplier=Future+Electronics; ComponentLink6Description: https://datasheet.ciiva.com/16340/jsts6b-ph-sm4-tb-lf-sn-16340154.pdf?src-supplier=Future+Electronics; Supplier Part Number 1: 6881369P; LCSC Part Number: C265405
L1 L2 = 78438357100: FIXED IND 10UH 2.7A 110MOHM SMD; Manufacturer: Wurth Elektronik; Item Type: Fixed Inductors; DC Resistance (DCR): 100.8mΩ; Value: 10µH; Supplier: DigiKey; Supplier Part Number: 732-11746-1-ND; Manufacturer Part Number: 78438357100; RoHS: Compliant; Stock: 6444; Pricing: 1=1.93, 10=1.893, 50=1.809, 100=1.667 (USD); Ambient Temperature Range High: 85°C; Ambient Temperature Range Low: -40°C; Current Rating: 2.7A; Height: 3mm; Length: 4mm; Max Operating Temperature: 125°C; Min Operating Temperature: -40°C; Width: 4mm; ComponentLink1URL: https://datasheet.octopart.com:443/78438357100-Wurth-Elektronik-datasheet-168498766.pdf?src-supplier=Wurth+Elektronik; ComponentLink1Description: https://datasheet.octopart.com:443/78438357100-Wurth-Elektronik-datasheet-168498766.pdf?src-supplier=Wurth+Elektronik
NT1 NT2 = Net Tie_SMD: Net Tie SMD; Manufacturer Part Number: Net Tie; Item Type: Net Tie Pad
Q1 = BSS84W-7-F: MOSFET P-CH 50V 130MA SOT323; Manufacturer: Diodes; Supplier: Future Electronics; Supplier Part Number: 3204492; Manufacturer Part Number: BSS84W-7-F; RoHS: Yes; Category: MOSFETs; Stock: 1359000; Pricing: 3000=0.415, 9000=0.405, 30000=0.39, 60000=0.385, 120000=0.375 (USD); ComponentLink1URL: https://datasheet.ciiva.com/17082/bss84w-7-f-17082780.pdf?src-supplier=Allied+Electronics; ComponentLink1Description: https://datasheet.ciiva.com/17082/bss84w-7-f-17082780.pdf?src-supplier=Allied+Electronics; ComponentLink2URL: https://datasheet.ciiva.com/15137/getdatasheetpartid-91759-15137729.pdf?src-supplier=Verical; ComponentLink2Description: https://datasheet.ciiva.com/15137/getdatasheetpartid-91759-15137729.pdf?src-supplier=Verical; ComponentLink3URL: https://datasheet.ciiva.com/19479/1539489-19479838.pdf?src-supplier=Jameco; ComponentLink3Description: https://datasheet.ciiva.com/19479/1539489-19479838.pdf?src-supplier=Jameco; ComponentLink4URL: https://datasheet.ciiva.com/4442/ds30205-79185-4442986.pdf?src-supplier=Mouser; ComponentLink4Description: https://datasheet.ciiva.com/4442/ds30205-79185-4442986.pdf?src-supplier=Mouser; ComponentLink5URL: https://datasheet.ciiva.com/8115/ds30205-8115434.pdf?src-supplier=Avnet; ComponentLink5Description: https://datasheet.ciiva.com/8115/ds30205-8115434.pdf?src-supplier=Avnet; ComponentLink6URL: https://datasheet.ciiva.com/934/ds30205-934605.pdf?src-supplier=Digi-Key; ComponentLink6Description: https://datasheet.ciiva.com/934/ds30205-934605.pdf?src-supplier=Digi-Key; ComponentLink7URL: https://datasheet.ciiva.com/934/ds30205-934606.pdf?src-supplier=Digi-Key; ComponentLink7Description: https://datasheet.ciiva.com/934/ds30205-934606.pdf?src-supplier=Digi-Key; ComponentLink8URL: https://datasheet.ciiva.com/934/ds30205-934607.pdf?src-supplier=Digi-Key; ComponentLink8Description: https://datasheet.ciiva.com/934/ds30205-934607.pdf?src-supplier=Digi-Key; ComponentLink9URL: https://datasheet.ciiva.com/1190/ds30205-1190308.pdf?src-supplier=Element14; ComponentLink9Description: https://datasheet.ciiva.com/1190/ds30205-1190308.pdf?src-supplier=Element14; ComponentLink10URL: https://datasheet.ciiva.com/8115/ds30205-8115325.pdf?src-supplier=Avnet; ComponentLink10Description: https://datasheet.ciiva.com/8115/ds30205-8115325.pdf?src-supplier=Avnet; LCSC Part Number: C110490; Item Type: Mosfet
Q2 Q3 = IPD034N06N3G: MOSFET N-CH 60V 100A TO252-3; Manufacturer: Infineon; Supplier: Mouser; Supplier Part Number: 726-IPD034N06N3G; Manufacturer Part Number: IPD034N06N3G; RoHS: Yes; Stock: 7587; Pricing: 1=1.76, 10=1.48, 50=1.48, 100=1.2, 1000=0.837, 10000=0.747 (USD); Item Type: Mosfet; LCSC Part Number: C94897
R4 R6 = RC0603FR-07100KL: RES 100K OHM 1% 1/10W 0603; Manufacturer: Yageo; Item Type: Resistors; Value: 100kR; Temperature Coefficient: 100ppm/°C; Voltage Rating (DC): 50V; Power Rating: 100mW; Supplier: Rs; LCSC Part Number: C14675; Manufacturer Part Number: RC0603FR-07100KL; RoHS: Yes; Stock: 27300; Case/Package: 0603; Pins: 2; Case Code (Imperial): 0603; Case Code (Metric): 1608; Min Operating Temperature: -55°C; Max Operating Temperature: 155°C; Tolerance: 1%; Resistor Type: Thick Film; Packaging: Tape and Reel; Voltage Rating: 50V; Termination: SMD/SMT; Number of Terminations: 2; Features: Moisture Resistant; Series: RC; Max Power Dissipation: 100mW; Resistance Tolerance: 1%; Construction: Rectangular; Technology: THICK FILM; Length: 1.6mm; Width: 0.8mm; Height: 0.45mm; Depth: 0.8mm; Reach SVHC Compliant: No; Lead Free: 5697LeadFree; Military Standard: Not; RoHS Compliant: Yes; Supplier Part Number: 2424020; Category: Chip SMD Resistors; Mounting Technology: Surface Mount; Weight: 7.1E-05oz; Package Quantity: 5000; ComponentLink1URL: https://datasheet.ciiva.com/11819/0900766b80f96399-11819227.pdf?src-supplier=Rs; ComponentLink1Description: https://datasheet.ciiva.com/11819/0900766b80f96399-11819227.pdf?src-supplier=Rs; ComponentLink2URL: https://datasheet.ciiva.com/2455/pyu-r-int-thick-7-2455183.pdf?src-supplier=Digikey; ComponentLink2Description: https://datasheet.ciiva.com/2455/pyu-r-int-thick-7-2455183.pdf?src-supplier=Digikey; ComponentLink3URL: https://datasheet.ciiva.com/2455/pyu-r-int-thick-7-2455184.pdf?src-supplier=Digikey; ComponentLink3Description: https://datasheet.ciiva.com/2455/pyu-r-int-thick-7-2455184.pdf?src-supplier=Digikey; ComponentLink4URL: https://datasheet.ciiva.com/2455/pyu-r-int-thick-7-2455182.pdf?src-supplier=Digikey; ComponentLink4Description: https://datasheet.ciiva.com/2455/pyu-r-int-thick-7-2455182.pdf?src-supplier=Digikey
R7 = RC0603FR-074K99L: RES 4.99K OHM 1% 1/10W 0603; Manufacturer: Yageo; Item Type: Resistors; Value: 4.99kR; Temperature Coefficient: 100ppm/°C; Voltage Rating (DC): 50V; Power Rating: 100mW; Voltage Rating: 75V; Supplier: Future Electronics; LCSC Part Number: C114621; Manufacturer Part Number: RC0603FR-074K99L; RoHS: Yes; Stock: 205000; Pricing: 5000=0.0009, 50000=0.0009, 150000=0.0008, 625000=0.0008, 1500000=0.0008 (USD); Case/Package: 0603; Pins: 2; Case Code (Imperial): 0603; Case Code (Metric): 1608; Weight: 7.1E-05oz; Min Operating Temperature: -55°C; Max Operating Temperature: 155°C; Packaging: Tape and Reel; Tolerance: 1%; Resistor Type: Thick Film; Termination: SMD/SMT; Number of Terminations: 2; Max Power Dissipation: 100mW; Features: Moisture Resistant; Series: RC; Construction: Rectangular; Resistance Tolerance: 1%; Length: 1.6mm; Width: 0.8mm; Height: 0.45mm; Depth: 0.8mm; Lead Free: Lead Free; Military Standard: Not; RoHS Compliant: Yes; Reach SVHC Compliant: Unknown
R8 = RC0603FR-0722K1L: RES 22.1K OHM 1% 1/10W 0603; Manufacturer: Yageo; Power Rating: 100mW; Resistance: 22.1kR; Voltage Rating: 50V; Temperature Coefficient: 100ppm/°C; Item Type: Resistor; Supplier 1: Avnet; Manufacturer Part Number: RC0603FR-0722K1L; RoHS: Yes; Category: Chip SMD Resistors; Stock 1: 595000; Pricing 1: 5000=0.00133, 10000=0.00131, 20000=0.00127 (USD); Case/Package: 0603; Case Code (Imperial): 0603; Case Code (Metric): 1608; Size Code: 0603; Min Operating Temperature: -55°C; Max Operating Temperature: 155°C; Tolerance: 1%; Package Quantity: 5000; Packaging: Tape and Reel; Termination: SMD/SMT; Voltage Rating (DC): 50V; Series: RC; Length: 1.6mm; Width: 0.8mm; Height: 0.45mm; Lead Free: Lead Free; RoHS Compliant: Yes; ComponentLink1URL: https://datasheet.ciiva.com/12555/rc0603-272842-12555287.pdf?src-supplier=Mouser; ComponentLink1Description: https://datasheet.ciiva.com/12555/rc0603-272842-12555287.pdf?src-supplier=Mouser; Supplier Part Number 1: RC0603FR-0722K1L; LCSC Part Number: C137768
R9 R26-R29 R55 R56 = RC0603JR-070RL: RES 0 OHM JUMPER 1/10W 0603; Manufacturer: Yageo; Resistance: 0mR; Tolerance: 1%; Power Rating: 100mW; Voltage Rating (DC): 50V; Temperature Coefficient: 200ppm/°C; Resistance Tolerance: 5%; Item Type: Resistor; Supplier 1: Digi-Key; Manufacturer Part Number: RC0603JR-070RL; RoHS: Yes; Category: Chip SMD Resistors; Stock 1: 18081776; Pricing 1: 1=0.10000, 10=0.01700, 25=0.01240, 50=0.00960, 100=0.00700, 250=0.00536, 500=0.00430, 1000=0.00316 (USD); Case/Package: 0603; Number of Pins: 2; Contact Plating: Tin,Matte; Case Code (Imperial): 0603; Case Code (Metric): 1608; Size Code: 0603; Min Operating Temperature: -55°C; Max Operating Temperature: 155°C; Resistor Type: Thick Film; Packaging: Tape and Reel; Termination: SMD/SMT; Series: RC; Technology: THICK FILM; Package Quantity: 5000; Voltage Rating: 50V; Features: Moisture Resistant; Max Power Dissipation: 100mW; Number of Terminations: 2; Construction: Rectangular; Length: 1.6mm; Width: 0.8mm; Height: 0.45mm; Depth: 0.8mm; Radiation Hardening: No; Reach SVHC Compliant: No SVHC; Lead Free: Lead Free; RoHS Compliant: Yes; Military Standard: Not; Supplier Part Number 1: 311-0.0GRCT-ND; LCSC Part Number: C95177
R10 R24 R25 R34 R42 R53 = RC0603FR-0710KL: RES SMD 10K Ohm 1% 1/10W 0603; Manufacturer: Yageo; Resistance: 10kR; Temperature Coefficient: 100ppm/°C; Voltage Rating (DC): 50V; Power Rating: 100mW; Voltage Rating: 75V; Item Type: Resistor; Supplier 1: Digi-Key; Manufacturer Part Number: RC0603FR-0710KL; RoHS: Yes; Category: Chip SMD Resistors; Stock 1: 25249139; Pricing 1: 1=0.10000, 10=0.02400, 100=0.00970, 1000=0.00436, 2500=0.00378 (USD); Case/Package: 0603; Number of Pins: 2; Case Code (Imperial): 0603; Case Code (Metric): 1608; Weight: 7.1E-05oz; Size Code: 0603; Min Operating Temperature: -55°C; Max Operating Temperature: 155°C; Tolerance: 1%; Resistor Type: Thick Film; Packaging: Tape and Reel; Termination: SMD/SMT; Features: Moisture Resistant; Series: RC; Max Power Dissipation: 100mW; Number of Terminations: 2; Resistance Tolerance: 1%; Construction: Rectangular; Length: 1.6mm; Width: 0.8mm; Height: 0.45mm; Depth: 0.8mm; Lead Pitch: 0.3mm; REACH SVHC: Unknown; Lead Free: Lead Free; Military Standard: Not; RoHS Compliant: Yes; ComponentLink1URL: https://datasheet.ciiva.com/7660/38590-7660789.pdf?src-supplier=Element14; ComponentLink1Description: https://datasheet.ciiva.com/7660/38590-7660789.pdf?src-supplier=Element14; ComponentLink2URL: https://datasheet.ciiva.com/7983/443971-7983596.pdf?src-supplier=Element14; ComponentLink2Description: https://datasheet.ciiva.com/7983/443971-7983596.pdf?src-supplier=Element14; ComponentLink3URL: https://datasheet.ciiva.com/22747/443971-22747519.pdf?src-supplier=Element14; ComponentLink3Description: https://datasheet.ciiva.com/22747/443971-22747519.pdf?src-supplier=Element14; ComponentLink4URL: https://datasheet.ciiva.com/46440/1868787-46440891.pdf?src-supplier=Element14; ComponentLink4Description: https://datasheet.ciiva.com/46440/1868787-46440891.pdf?src-supplier=Element14; ComponentLink5URL: https://datasheet.ciiva.com/7746/1738695-7746239.pdf?src-supplier=Element14; ComponentLink5Description: https://datasheet.ciiva.com/7746/1738695-7746239.pdf?src-supplier=Element14; ComponentLink6URL: https://datasheet.ciiva.com/15189/getdatasheetpartid-409289-15189591.pdf?src-supplier=Verical; ComponentLink6Description: https://datasheet.ciiva.com/15189/getdatasheetpartid-409289-15189591.pdf?src-supplier=Verical; Supplier Part Number 1: 311-10.0KHRCT-ND; LCSC Part Number: C98220
R23 = RC0603FR-071KL: RES SMD 1K OHM 1% 1/10W 0603; Manufacturer: Yageo; Resistance: 1kR; Temperature Coefficient: 100ppm/°C; Power Rating: 100mW; Voltage Rating: 50V; Item type: Resistor; ComponentLink1URL: https://www.verical.com/server-webapp/html/getDatasheet?partID=409289&src-supplier=Verical; ComponentLink1Description: https://www.verical.com/server-webapp/html/getDatasheet?partID=409289&src-supplier=Verical; Supplier 1: Digi-Key; Manufacturer Part Number: RC0603FR-071KL; Stock 1: 21472395; Pricing 1: 1=0.1, 10=0.023, 100=0.0094, 1000=0.0042, 2500=0.0037 (USD); Case/Package: 0603; Contact Plating: Tin,Matte; Case Code (Imperial): 0603; Case Code (Metric): 1608; Min Operating Temperature: -55°C; Max Operating Temperature: 155°C; Tolerance: 1%; Composition: Thick Film; Packaging: Tape and Reel; Termination: SMD/SMT; Military Standard: Not; Length: 1.6mm; Height: 0.45mm; Depth: 0.8mm; Radiation Hardening: No; REACH SVHC: No SVHC; Lead Free: Lead Free; ComponentLink2URL: http://documents.rs-components.com/techlib://itc_doclist_GB.htm?stockno=5048928&src-supplier=RSComponents; ComponentLink2Description: http://documents.rs-components.com/techlib://itc_doclist_GB.htm?stockno=5048928&src-supplier=RSComponents; ComponentLink3URL: http://www.yageo.com/documents/recent/PYu-RC0603_51_RoHS_L_4.pdf?src-supplier=Avnet+Europe; ComponentLink3Description: http://www.yageo.com/documents/recent/PYu-RC0603_51_RoHS_L_4.pdf?src-supplier=Avnet+Europe; ComponentLink4URL: http://www.farnell.com/datasheets/2167052.pdf?src-supplier=Element14; ComponentLink4Description: http://www.farnell.com/datasheets/2167052.pdf?src-supplier=Element14; ComponentLink5URL: http://www.farnell.com/datasheets/1868787.pdf?src-supplier=Element14; ComponentLink5Description: http://www.farnell.com/datasheets/1868787.pdf?src-supplier=Element14; ComponentLink6URL: http://www.yageo.com/documents/recent/PYu-RC_Group_51_RoHS_L_2.pdf?src-supplier=Avnet; ComponentLink6Description: http://www.yageo.com/documents/recent/PYu-RC_Group_51_RoHS_L_2.pdf?src-supplier=Avnet; ComponentLink7URL: https://www.verical.com/server-webapp/html/getDatasheet?partID=404327&src-supplier=Verical; ComponentLink7Description: https://www.verical.com/server-webapp/html/getDatasheet?partID=404327&src-supplier=Verical; ComponentLink8URL: http://www.farnell.com/datasheets/443971.pdf?src-supplier=Element14; ComponentLink8Description: http://www.farnell.com/datasheets/443971.pdf?src-supplier=Element14; Supplier Part Number 1: 311-1.00KHRDKR-ND; LCSC Part Number: C22548
R30 = RC0603FR-07499KL: RES 499K OHM 1% 1/10W 0603; Manufacturer: Yageo; Voltage Rating (DC): 50V; Item Type: Resistor; Supplier: Future Electronics; Supplier Part Number: 1580604; Manufacturer Part Number: RC0603FR-07499KL; RoHS: Yes; Category: Chip SMD Resistors; Stock: 750000; Pricing: 5000=0.0015, 50000=0.0014, 200000=0.0014, 625000=0.0013, 2000000=0.0012 (USD); Lead Free: 5697LeadFree; ComponentLink1URL: https://datasheet.ciiva.com/15189/getdatasheetpartid-329306-15189746.pdf?src-supplier=Verical; ComponentLink1Description: https://datasheet.ciiva.com/15189/getdatasheetpartid-329306-15189746.pdf?src-supplier=Verical; ComponentLink2URL: https://datasheet.ciiva.com/11819/0900766b80f96399-11819364.pdf?src-supplier=Rs; ComponentLink2Description: https://datasheet.ciiva.com/11819/0900766b80f96399-11819364.pdf?src-supplier=Rs; ComponentLink3URL: https://datasheet.ciiva.com/2454/pyu-r-int-thick-7-2454186.pdf?src-supplier=Digi-Key; ComponentLink3Description: https://datasheet.ciiva.com/2454/pyu-r-int-thick-7-2454186.pdf?src-supplier=Digi-Key; ComponentLink4URL: https://datasheet.ciiva.com/2454/pyu-r-int-thick-7-2454187.pdf?src-supplier=Digi-Key; ComponentLink4Description: https://datasheet.ciiva.com/2454/pyu-r-int-thick-7-2454187.pdf?src-supplier=Digi-Key; ComponentLink5URL: https://datasheet.ciiva.com/2454/pyu-r-int-thick-7-2454188.pdf?src-supplier=Digi-Key; ComponentLink5Description: https://datasheet.ciiva.com/2454/pyu-r-int-thick-7-2454188.pdf?src-supplier=Digi-Key; LCSC Part Number: C131054
R31 R32 = RC0603FR-074K7L: RES SMD 4.7K OHM 1% 1/10W 0603; Manufacturer: Yageo; Item Type: Resistor; Manufacturer Part Number: RC0603FR-074K7L; Package: 0603; ComponentLink7Description: LCSC; ComponentLink7URL: https://www.lcsc.com/product-detail/Chip-Resistor-Surface-Mount_YAGEO-RC0603FR-074K7L_C99782.html; LCSC Part Number: C99782
R33 R35 R37-R39 R41 R43 R47 = AC0805FR-07100RL: RES SMD 100 OHM 1% 1/8W 0805; Manufacturer: Yageo; Item Type: Resistor; Manufacturer Part Number: AC0805FR-07100RL; ComponentLink1URL: https://datasheet.ciiva.com/12656/pyu-ac-51-rohs-l-2-12656967.pdf?src-supplier=Mouser; ComponentLink1Description: https://datasheet.ciiva.com/12656/pyu-ac-51-rohs-l-2-12656967.pdf?src-supplier=Mouser; LCSC Part Number: C138274; Supplier: Future Electronics; Supplier Part Number: 6087312; RoHS: Yes; Category: Chip SMD Resistors; Stock: 70000; Pricing: 5000=0.0032, 25000=0.003, 125000=0.0028, 375000=0.0027, 1000000=0.0025 (USD)
R40 = HoLRS3920-3W-1mR-1%: 3W ±1% 1mΩ 3920 Chip Resistor - Surface Mount ROHS; Manufacturer: Milliohm; Manufacturer Part Number: HoLRS3920-3W-1mR-1%; Package: 3920; LCSC Part Number: C5336202; Item Type: Resistor; ComponentLink1Description: LCSC; ComponentLink1URL: C5336202